# Altium schematic sheet 21_WIFI_BLE_Module.SchDoc
size A3; SheetNumber: 8; SheetTotal: 21
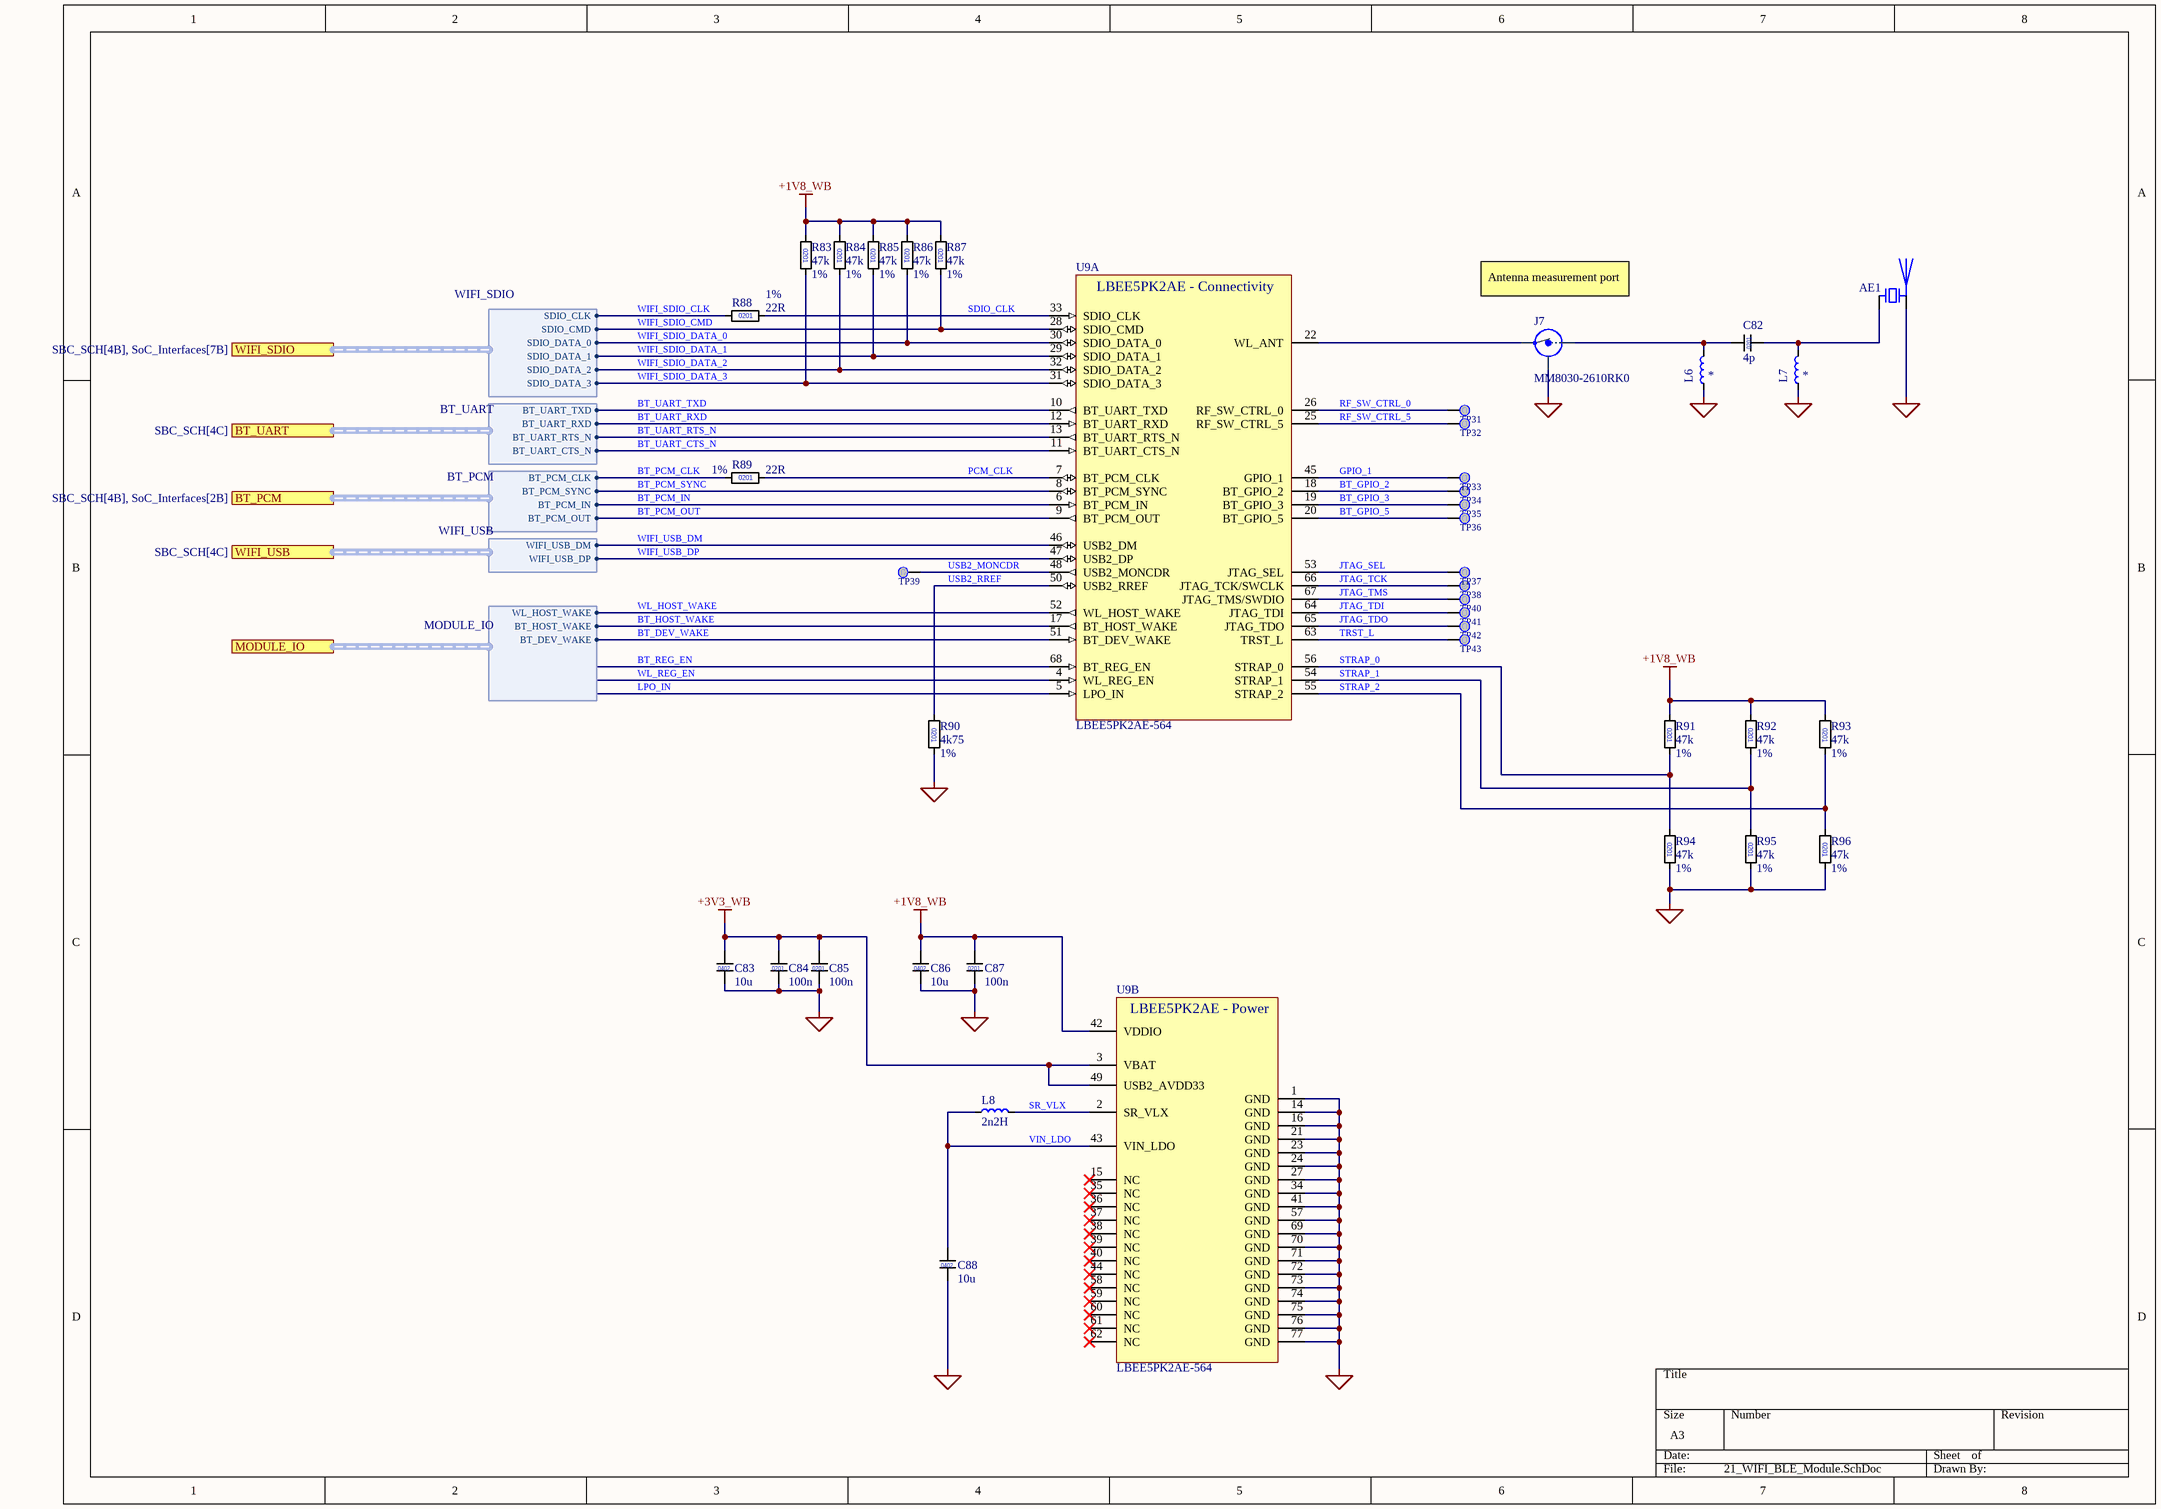
[diagram p0: 21_WIFI_BLE_Module.SchDoc]

## Parts
AE1  Antenna_Chip  [2450AD14A5500001T]  (value not drawn)
C82  value 4p  [C0201]  (hidden comment: C_0201)
C83  value 10u  [C0402]  (hidden comment: 4u7)
C84  value 100n  [C0201]  (hidden comment: C_0201)
C85  value 100n  [C0201]  (hidden comment: C_0201)
C86  value 10u  [C0402]  (hidden comment: 4u7)
C87  value 100n  [C0201]  (hidden comment: C_0201)
C88  value 10u  [C0402]  (hidden comment: 4u7)
J7  MM8030-2610RK0  [COAXIAL-SWG]
L6  L  [FB0201]  (value not drawn)
L7  L  [FB0201]  (value not drawn)
L8  value 2n2H  (hidden comment: L)
R83  value 47k  Tolerance: 1%  [R0201]  (hidden comment: 0201)
R84  value 47k  Tolerance: 1%  [R0201]  (hidden comment: 0201)
R85  value 47k  Tolerance: 1%  [R0201]  (hidden comment: 0201)
R86  value 47k  Tolerance: 1%  [R0201]  (hidden comment: 0201)
R87  value 47k  Tolerance: 1%  [R0201]  (hidden comment: 0201)
R88  value 22R  Tolerance: 1%  [R0201]  (hidden comment: 0201)
R89  value 22R  Tolerance: 1%  [R0201]  (hidden comment: 0201)
R90  value 4k75  Tolerance: 1%  [R0201]  (hidden comment: 0201)
R91  value 47k  Tolerance: 1%  [R0201]  (hidden comment: 0201)
R92  value 47k  Tolerance: 1%  [R0201]  (hidden comment: 0201)
R93  value 47k  Tolerance: 1%  [R0201]  (hidden comment: 0201)
R94  value 47k  Tolerance: 1%  [R0201]  (hidden comment: 0201)
R95  value 47k  Tolerance: 1%  [R0201]  (hidden comment: 0201)
R96  value 47k  Tolerance: 1%  [R0201]  (hidden comment: 0201)
TP31  Testpoint 0.5mm  [TP_0.50mm]  (value not drawn)  (no BOM)
TP32  Testpoint 0.5mm  [TP_0.50mm]  (value not drawn)  (no BOM)
TP33  Testpoint 0.5mm  [TP_0.50mm]  (value not drawn)  (no BOM)
TP34  Testpoint 0.5mm  [TP_0.50mm]  (value not drawn)  (no BOM)
TP35  Testpoint 0.5mm  [TP_0.50mm]  (value not drawn)  (no BOM)
TP36  Testpoint 0.5mm  [TP_0.50mm]  (value not drawn)  (no BOM)
TP37  Testpoint 0.5mm  [TP_0.50mm]  (value not drawn)  (no BOM)
TP38  Testpoint 0.5mm  [TP_0.50mm]  (value not drawn)  (no BOM)
TP39  Testpoint 0.5mm  [TP_0.50mm]  (value not drawn)  (no BOM)
TP40  Testpoint 0.5mm  [TP_0.50mm]  (value not drawn)  (no BOM)
TP41  Testpoint 0.5mm  [TP_0.50mm]  (value not drawn)  (no BOM)
TP42  Testpoint 0.5mm  [TP_0.50mm]  (value not drawn)  (no BOM)
TP43  Testpoint 0.5mm  [TP_0.50mm]  (value not drawn)  (no BOM)
U9  LBEE5PK2AE-564  [LBEE5PK2AE-564]  (parts A,B of 2)

## Ports
BT_PCM (harness BT_PCM, see SBC_SCH[4B], SoC_Interfaces[2B]), BT_UART (harness BT_UART, see SBC_SCH[4C]), MODULE_IO (harness MODULE_IO), WIFI_SDIO (harness WIFI_SDIO, see SBC_SCH[4B], SoC_Interfaces[7B]), WIFI_USB (harness WIFI_USB, see SBC_SCH[4C])

## Harnesses
WIFI_SDIO: SDIO_DATA_0, SDIO_DATA_1, SDIO_DATA_2, SDIO_DATA_3, SDIO_CLK, SDIO_CMD
BT_UART: BT_UART_TXD, BT_UART_RXD, BT_UART_RTS_N, BT_UART_CTS_N
BT_PCM: BT_PCM_CLK, BT_PCM_SYNC, BT_PCM_IN, BT_PCM_OUT
WIFI_USB: WIFI_USB_DM, WIFI_USB_DP
MODULE_IO: WL_HOST_WAKE, BT_HOST_WAKE, BT_DEV_WAKE

## Nets
+1V8_WB: C86.1 C87.1 R83.1 R84.1 R85.1 R86.1 R87.1 R91.1 R92.1 R93.1 U9.42(VDDIO)
+3V3_WB: C83.1 C84.1 C85.1 U9.3(VBAT) U9.49(USB2_AVDD33)
GND: AE1.1(GND) C83.2 C84.2 C85.2 C86.2 C87.2 C88.2 J7.2,4(GND) L6.1 L7.1 R90.2 R94.2 R95.2 R96.2 U9.1(GND) U9.14(GND) U9.16(GND) U9.21(GND) U9.23(GND) U9.24(GND) U9.27(GND) U9.34(GND) U9.41(GND) U9.57(GND) U9.69(GND) U9.70(GND) U9.71(GND) U9.72(GND) U9.73(GND) U9.74(GND) U9.75(GND) U9.76(GND) U9.77(GND)
BT_DEV_WAKE: U9.51(BT_DEV_WAKE) ; port MODULE_IO.BT_DEV_WAKE
BT_GPIO_2: TP34.TP U9.18(BT_GPIO_2)
BT_GPIO_3: TP35.TP U9.19(BT_GPIO_3)
BT_GPIO_5: TP36.TP U9.20(BT_GPIO_5)
BT_HOST_WAKE: U9.17(BT_HOST_WAKE) ; port MODULE_IO.BT_HOST_WAKE
BT_PCM_CLK: R89.1 ; port BT_PCM.BT_PCM_CLK
BT_PCM_IN: U9.6(BT_PCM_IN) ; port BT_PCM.BT_PCM_IN
BT_PCM_OUT: U9.9(BT_PCM_OUT) ; port BT_PCM.BT_PCM_OUT
BT_PCM_SYNC: U9.8(BT_PCM_SYNC) ; port BT_PCM.BT_PCM_SYNC
BT_REG_EN: U9.68(BT_REG_EN)
BT_UART_CTS_N: U9.11(BT_UART_CTS_N) ; port BT_UART.BT_UART_CTS_N
BT_UART_RTS_N: U9.13(BT_UART_RTS_N) ; port BT_UART.BT_UART_RTS_N
BT_UART_RXD: U9.12(BT_UART_RXD) ; port BT_UART.BT_UART_RXD
BT_UART_TXD: U9.10(BT_UART_TXD) ; port BT_UART.BT_UART_TXD
GPIO_1: TP33.TP U9.45(GPIO_1)
JTAG_SEL: TP37.TP U9.53(JTAG_SEL)
JTAG_TCK: TP38.TP U9.66(JTAG_TCK/SWCLK)
JTAG_TDI: TP41.TP U9.64(JTAG_TDI)
JTAG_TDO: TP42.TP U9.65(JTAG_TDO)
JTAG_TMS: TP40.TP U9.67(JTAG_TMS/SWDIO)
LPO_IN: U9.5(LPO_IN)
PCM_CLK: R89.2 U9.7(BT_PCM_CLK)
RF_SW_CTRL_0: TP31.TP U9.26(RF_SW_CTRL_0)
RF_SW_CTRL_5: TP32.TP U9.25(RF_SW_CTRL_5)
SDIO_CLK: R88.2 U9.33(SDIO_CLK)
SR_VLX: L8.2 U9.2(SR_VLX)
STRAP_0: R91.2 R94.1 U9.56(STRAP_0)
STRAP_1: R92.2 R95.1 U9.54(STRAP_1)
STRAP_2: R93.2 R96.1 U9.55(STRAP_2)
TRST_L: TP43.TP U9.63(TRST_L)
USB2_MONCDR: TP39.TP U9.48(USB2_MONCDR)
USB2_RREF: R90.1 U9.50(USB2_RREF)
VIN_LDO: C88.1 L8.1 U9.43(VIN_LDO)
WIFI_SDIO_CLK: R88.1 ; port WIFI_SDIO.SDIO_CLK
WIFI_SDIO_CMD: R87.2 U9.28(SDIO_CMD) ; port WIFI_SDIO.SDIO_CMD
WIFI_SDIO_DATA_0: R86.2 U9.30(SDIO_DATA_0) ; port WIFI_SDIO.SDIO_DATA_0
WIFI_SDIO_DATA_1: R85.2 U9.29(SDIO_DATA_1) ; port WIFI_SDIO.SDIO_DATA_1
WIFI_SDIO_DATA_2: R84.2 U9.32(SDIO_DATA_2) ; port WIFI_SDIO.SDIO_DATA_2
WIFI_SDIO_DATA_3: R83.2 U9.31(SDIO_DATA_3) ; port WIFI_SDIO.SDIO_DATA_3
WIFI_USB_DM: U9.46(USB2_DM) ; port WIFI_USB.WIFI_USB_DM
WIFI_USB_DP: U9.47(USB2_DP) ; port WIFI_USB.WIFI_USB_DP
WL_HOST_WAKE: U9.52(WL_HOST_WAKE) ; port MODULE_IO.WL_HOST_WAKE
WL_REG_EN: U9.4(WL_REG_EN)
NetAE1_4: AE1.4(FEED) C82.2 L7.2
NetC82_1: C82.1 J7.1(IN) L6.2
NetJ7_3: J7.3(OUT) U9.22(WL_ANT)

Not connected (* = marked no-connect by the designer): U9 15(NC)* 35(NC)* 36(NC)* 37(NC)* 38(NC)* 39(NC)* 40(NC)* 44(NC)* 58(NC)* 59(NC)* 60(NC)* 61(NC)* 62(NC)*

## Notes on the sheet
- (near J7) Antenna measurement port
- (in symbol C_0201) 0201
- (in symbol C_0402) 0402
- (in symbol LBEE5PK2AE-564, part A) LBEE5PK2AE - Connectivity
- (in symbol LBEE5PK2AE-564, part B) LBEE5PK2AE - Power

## Library data of the parts
AE1 = Antenna_Chip: Ceramic chip antenna with pin for PCB trace
C82 C84 C85 C87 = C_0201: MLCC 0201; Manufacturer_Name: *; Manufacturer_Part_Number: *
C83 C86 C88 = C_0402: MLCC 0402; Manufacturer_Name: *; Manufacturer_Part_Number: *
J7 = MM8030-2610RK0: SWG Connector Receptacle, Female Socket 50 Ohms Surface Mount Solder; Manufacturer_Name: *; Manufacturer_Part_Number: *; Value: MM8030-2610RK0
L6 L7 = L_0201: Inductor; Manufacturer_Name: *; Manufacturer_Part_Number: *; Value: *
L8 = L_0806: Inductor; Manufacturer_Name: *; Manufacturer_Part_Number: *
R83-R96 = R_0201: Manufacturer_Name: *; Manufacturer_Part_Number: *
U9 = LBEE5PK2AE-564: Murata Type 2AE Wi-Fi 802.11a/b/g/n/ac + Bluetooth 5.2 combo module, Infineon CYW4373E, SDIO/USB host interface, 8.0x7.8mm LGA-77; KiCad_Footprint: RF_Module:Murata_LBEE5PK2AE-564; Datasheet: https://www.murata.com/products/productdata/8816428220446/type2ae.pdf; ComponentLink1Description: Datasheet; ComponentLink1URL: https://www.murata.com/products/productdata/8816428220446/type2ae.pdf; Manufacturer_Name: *; Manufacturer_Part_Number: *